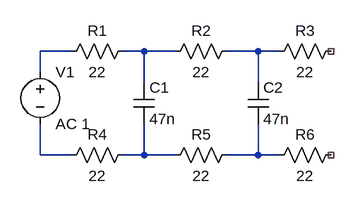
[diagram p0: schematic filtro_cry_abierto.asc]
filtro_cry_abierto.asc, the LTspice schematic file:
Version 4.1
SHEET 1 1204 680
WIRE -48 80 -96 80
WIRE 64 80 32 80
WIRE 112 80 64 80
WIRE 240 80 192 80
WIRE 272 80 240 80
WIRE -96 112 -96 80
WIRE 64 128 64 80
WIRE 240 128 240 80
WIRE -96 240 -96 192
WIRE -48 240 -96 240
WIRE 64 240 64 192
WIRE 64 240 32 240
WIRE 112 240 64 240
WIRE 240 240 240 192
WIRE 240 240 192 240
WIRE 272 240 240 240
SYMBOL res 48 64 R90
WINDOW 0 0 56 VBottom 2
WINDOW 3 32 56 VTop 2
SYMATTR InstName R1
SYMATTR Value 22
SYMBOL res 208 64 R90
WINDOW 0 0 56 VBottom 2
WINDOW 3 32 56 VTop 2
SYMATTR InstName R2
SYMATTR Value 22
SYMBOL res 368 64 R90
WINDOW 0 0 56 VBottom 2
WINDOW 3 32 56 VTop 2
SYMATTR InstName R3
SYMATTR Value 22
SYMBOL res 48 224 R90
WINDOW 0 0 56 VBottom 2
WINDOW 3 32 56 VTop 2
SYMATTR InstName R4
SYMATTR Value 22
SYMBOL res 208 224 R90
WINDOW 0 0 56 VBottom 2
WINDOW 3 32 56 VTop 2
SYMATTR InstName R5
SYMATTR Value 22
SYMBOL res 368 224 R90
WINDOW 0 0 56 VBottom 2
WINDOW 3 32 56 VTop 2
SYMATTR InstName R6
SYMATTR Value 22
SYMBOL cap 48 128 R0
SYMATTR InstName C1
SYMATTR Value 47n
SYMBOL cap 224 128 R0
SYMATTR InstName C2
SYMATTR Value 47n
SYMBOL voltage -96 96 R0
WINDOW 123 0 0 Left 0
WINDOW 39 0 0 Left 0
SYMATTR InstName V1
SYMATTR Value AC 1

The netlist it stands for:
* filtro_cry_abierto.asc
R1 N002 N001 22
R2 N003 N002 22
R3 NC_01 N003 22
R4 N005 N004 22
R5 N006 N005 22
R6 NC_02 N006 22
C1 N002 N005 47n
C2 N003 N006 47n
V1 N001 N004 AC 1
.backanno
.end